# Altium schematic sheet 03_SDRAM.SchDoc
size A4; SheetNumber: 3; SheetTotal: 6
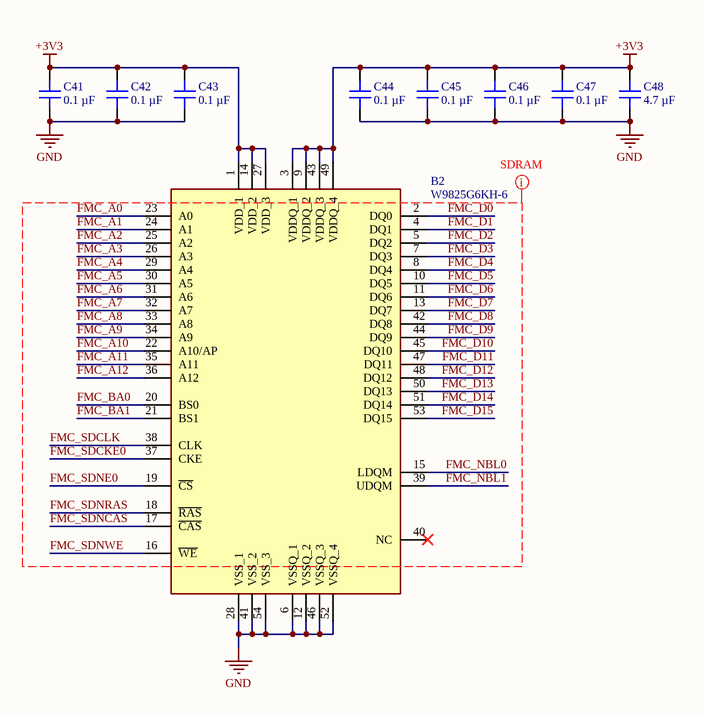
[diagram p0: 03_SDRAM.SchDoc]

## Parts
B2  W9825G6KH-6  [SOP80P1176X120-54N]
C41  0.1 µF  [CAP 0201_0603]
C42  0.1 µF  [CAP 0201_0603]
C43  0.1 µF  [CAP 0201_0603]
C44  0.1 µF  [CAP 0201_0603]
C45  0.1 µF  [CAP 0201_0603]
C46  0.1 µF  [CAP 0201_0603]
C47  0.1 µF  [CAP 0201_0603]
C48  4.7 µF  [CAP 0603_1608]

## Nets
+3V3: B2.1(VDD_1) B2.3(VDDQ_1) B2.9(VDDQ_2) B2.14(VDD_2) B2.27(VDD_3) B2.43(VDDQ_3) B2.49(VDDQ_4) C41.2 C42.2 C43.2 C44.2 C45.2 C46.2 C47.2 C48.2
GND: B2.6(VSSQ_1) B2.12(VSSQ_2) B2.28(VSS_1) B2.41(VSS_2) B2.46(VSSQ_3) B2.52(VSSQ_4) B2.54(VSS_3) C41.1 C42.1 C43.1 C44.1 C45.1 C46.1 C47.1 C48.1
FMC_A0: B2.23(A0)
FMC_A1: B2.24(A1)
FMC_A2: B2.25(A2)
FMC_A3: B2.26(A3)
FMC_A4: B2.29(A4)
FMC_A5: B2.30(A5)
FMC_A6: B2.31(A6)
FMC_A7: B2.32(A7)
FMC_A8: B2.33(A8)
FMC_A9: B2.34(A9)
FMC_A10: B2.22(A10/AP)
FMC_A11: B2.35(A11)
FMC_A12: B2.36(A12)
FMC_BA0: B2.20(BS0)
FMC_BA1: B2.21(BS1)
FMC_D0: B2.2(DQ0)
FMC_D1: B2.4(DQ1)
FMC_D2: B2.5(DQ2)
FMC_D3: B2.7(DQ3)
FMC_D4: B2.8(DQ4)
FMC_D5: B2.10(DQ5)
FMC_D6: B2.11(DQ6)
FMC_D7: B2.13(DQ7)
FMC_D8: B2.42(DQ8)
FMC_D9: B2.44(DQ9)
FMC_D10: B2.45(DQ10)
FMC_D11: B2.47(DQ11)
FMC_D12: B2.48(DQ12)
FMC_D13: B2.50(DQ13)
FMC_D14: B2.51(DQ14)
FMC_D15: B2.53(DQ15)
FMC_NBL0: B2.15(LDQM)
FMC_NBL1: B2.39(UDQM)
FMC_SDCKE0: B2.37(CKE)
FMC_SDCLK: B2.38(CLK)
FMC_SDNCAS: B2.17(~{CAS})
FMC_SDNE0: B2.19(~{CS})
FMC_SDNRAS: B2.18(~{RAS})
FMC_SDNWE: B2.16(~{WE})

Not connected (* = marked no-connect by the designer): B2 40(NC)*

## Layout directives
mark named SDRAM: FMC_A0, FMC_A1, FMC_A2, FMC_A3, FMC_A4, FMC_A5, FMC_A6, FMC_A7, FMC_A8, FMC_A9, FMC_A10, FMC_A11, FMC_A12, FMC_BA0, FMC_BA1, FMC_D0, FMC_D1, FMC_D2, FMC_D3, FMC_D4, FMC_D5, FMC_D6, FMC_D7, FMC_D8, FMC_D9, FMC_D10, FMC_D11, FMC_D12, FMC_D13, FMC_D14, FMC_D15, FMC_NBL0, FMC_NBL1, FMC_SDCKE0, FMC_SDCLK, FMC_SDNCAS, FMC_SDNE0, FMC_SDNRAS, FMC_SDNWE

## Library data of the parts
B2 = W9825G6KH-6: 256Mb SDRAM 166MHz TSOPII54; Manufacturer_Name: Winbond; Geometry.Height: 1.2mm; Manufacturer_Part_Number: W9825G6KH-6; Mouser Part Number: 454-W9825G6KH-6; Mouser Price/Stock: https://www.mouser.co.uk/ProductDetail/Winbond/W9825G6KH-6?qs=qSfuJ%252Bfl%2Fd4uj%2FIr3zKOng%3D%3D; Arrow Part Number: W9825G6KH-6; Arrow Price/Stock: https://www.arrow.com/en/products/w9825g6kh-6/winbond-electronics?utm_currency=USD&region=nac; Datasheet Link: https://www.winbond.com/hq/search-resource-file.jsp?partNo=W9825G6KH-6&type=datasheet
C41-C47 = CC0201KRX7R5BB104: CAP CER 0.1UF 6.3V X7R 0201; Manufacturer: Yageo; id: 2076; Tolerance: ±10%; Part Number: CC0201KRX7R5BB104; Value: 0.1 µF; Temperature Coefficient: X7R; Supplier Part Number 1: 13-CC0201KRX7R5BB104CT-ND; ComponentLink2Description: DigiKey Link; ComponentLink1URL: https://www.yageo.com/upload/media/product/productsearch/datasheet/mlcc/UPY-GPHC_X7R_6.3V-to-50V_20.pdf; PartId: 44620; Supplier 1: DigiKey; Series: CC; LastUpdated: 2023-01-03T20:00:55.290; Part Status: Active; Capacitance: 0.1 µF; Device Package: 0201 (0603 Metric); Thickness (Max): 0.013" (0.33mm); Voltage - Rated: 6.3V; Minimum Order: 1; Packaging: TapeAndReel; Applications: General Purpose; Package / Case: 0201 (0603 Metric); ComponentLink1Description: Datasheet; Price: 0.01; ComponentLink2URL: https://www.digikey.com/en/products/detail/yageo/CC0201KRX7R5BB104/12698853; Lifecycle Status: Active; Operating Temperature: -55°C ~ 125°C; Size / Dimension: 0.024" L x 0.012" W (0.60mm x 0.30mm); Mounting Type: Surface Mount, MLCC
C48 = CL10A475KP8NNNC: CAP CER 4.7UF 10V X5R 0603; Manufacturer: Samsung Electro-Mechanics; id: 830; Tolerance: ±10%; Part Number: CL10A475KP8NNNC; Value: 4.7 µF; Temperature Coefficient: X5R; Supplier Part Number 1: 1276-1044-1-ND; ComponentLink2Description: DigiKey Link; ComponentLink1URL: http://www.samsungsem.com/kr/support/product-search/mlcc/CL10A475KP8NNNC.jsp; PartId: 5671; Supplier 1: DigiKey; Series: CL; LastUpdated: 2023-01-03T20:07:38.840; Part Status: Active; Capacitance: 4.7 µF; Device Package: 0603 (1608 Metric); Thickness (Max): 0.035" (0.90mm); Voltage - Rated: 10V; Minimum Order: 1; Packaging: TapeAndReel; Applications: General Purpose; Package / Case: 0603 (1608 Metric); ComponentLink1Description: Datasheet; Price: 0.01; ComponentLink2URL: https://www.digikey.com/en/products/detail/samsung-electro-mechanics/CL10A475KP8NNNC/3886702; Lifecycle Status: Active; Operating Temperature: -55°C ~ 85°C; Size / Dimension: 0.063" L x 0.031" W (1.60mm x 0.80mm); Mounting Type: Surface Mount, MLCC